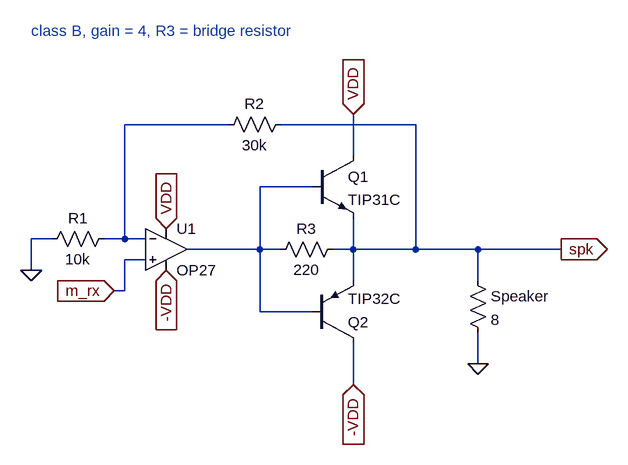
[diagram p0: schematic Power_Amp_RX.asc]
Power_Amp_RX.asc, the LTspice schematic file:
Version 4.1
SHEET 1 880 680
WIRE 144 -48 -16 -48
WIRE 432 -48 224 -48
WIRE 336 0 336 -64
WIRE 272 48 192 48
WIRE -128 128 -160 128
WIRE -16 128 -16 -48
WIRE -16 128 -48 128
WIRE 16 128 -16 128
WIRE 192 144 192 48
WIRE 192 144 80 144
WIRE 224 144 192 144
WIRE 336 144 336 96
WIRE 336 144 304 144
WIRE 432 144 432 -48
WIRE 432 144 336 144
WIRE 528 144 432 144
WIRE 656 144 528 144
WIRE 16 160 -16 160
WIRE -160 176 -160 128
WIRE 336 192 336 144
WIRE 528 192 528 144
WIRE -16 208 -16 160
WIRE -16 208 -32 208
WIRE 192 240 192 144
WIRE 272 240 192 240
WIRE 528 320 528 272
WIRE 336 352 336 288
FLAG 528 320 0
FLAG -160 176 0
FLAG -32 208 m_rx
IOPIN -32 208 In
FLAG 48 112 VDD
IOPIN 48 112 In
FLAG 48 176 -VDD
IOPIN 48 176 In
FLAG 336 -64 VDD
IOPIN 336 -64 In
FLAG 336 352 -VDD
IOPIN 336 352 In
FLAG 656 144 spk
IOPIN 656 144 Out
SYMBOL OpAmps\\OP27 48 80 R0
SYMATTR InstName U1
SYMBOL npn 272 0 R0
SYMATTR InstName Q1
SYMATTR Value TIP31C
SYMBOL pnp 272 288 M180
SYMATTR InstName Q2
SYMATTR Value TIP32C
SYMBOL res -32 112 R90
WINDOW 0 0 56 VBottom 2
WINDOW 3 32 56 VTop 2
SYMATTR InstName R1
SYMATTR Value 10k
SYMBOL res 240 -64 R90
WINDOW 0 0 56 VBottom 2
WINDOW 3 32 56 VTop 2
SYMATTR InstName R2
SYMATTR Value 30k
SYMBOL res 512 176 R0
SYMATTR InstName Speaker
SYMATTR Value 8
SYMBOL res 320 128 R90
WINDOW 0 0 56 VBottom 2
WINDOW 3 32 56 VTop 2
SYMATTR InstName R3
SYMATTR Value 220
TEXT -160 -192 Left 2 ;class B, gain = 4, R3 = bridge resistor

The netlist it stands for:
* Power_Amp_RX.asc
X§U1 m_rx N001 VDD -VDD N002 OP27  ; pins In+ In- V+ V- OUT
Q1 VDD N002 spk 0 TIP31C
Q2 -VDD N002 spk 0 TIP32C
R1 N001 0 10k
R2 spk N001 30k
R§Speaker spk 0 8
R3 spk N002 220
.model NPN NPN
.model PNP PNP
.lib standard.bjt
* class B, gain = 4, R3 = bridge resistor
.lib ADI.lib
.backanno
.end